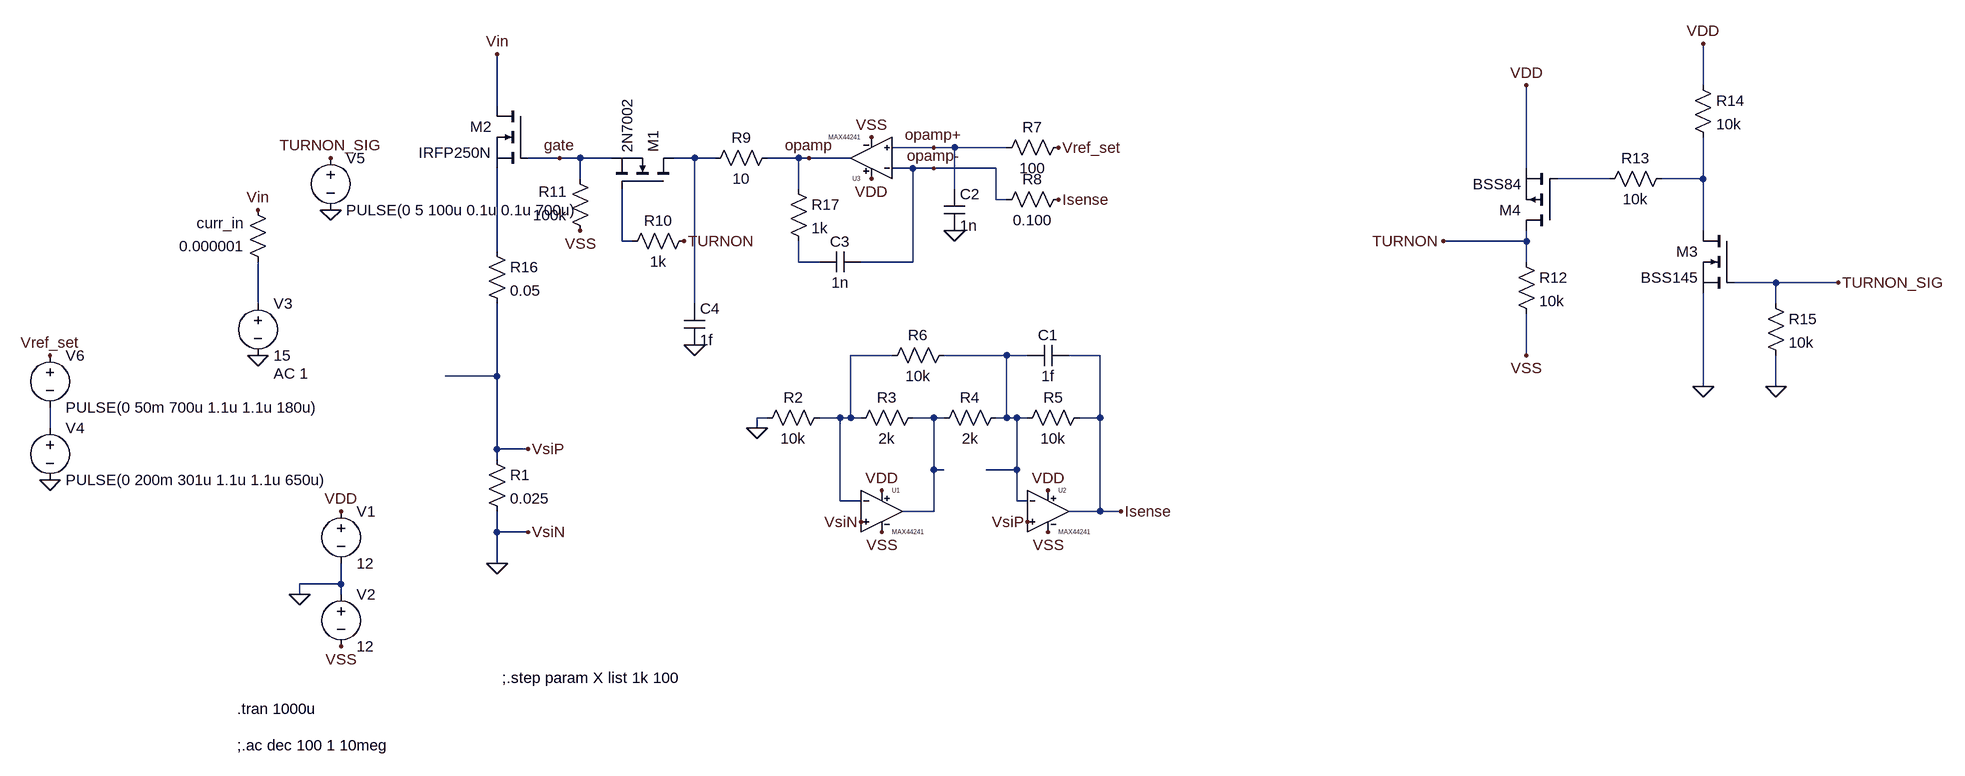
[diagram p0: schematic dc_load_transients.asc]
dc_load_transients.asc, the LTspice schematic file:
Version 4
SHEET 1 1884 680
WIRE 1504 -368 1504 -432
WIRE -352 -336 -352 -416
WIRE 320 -272 256 -272
WIRE 352 -272 320 -272
WIRE 432 -272 352 -272
WIRE -256 -256 -304 -256
WIRE -224 -256 -256 -256
WIRE -176 -256 -224 -256
WIRE -48 -256 -80 -256
WIRE -16 -256 -48 -256
WIRE 112 -256 64 -256
WIRE 128 -256 112 -256
WIRE 192 -256 128 -256
WIRE 288 -240 256 -240
WIRE 320 -240 288 -240
WIRE 416 -240 320 -240
WIRE 1232 -240 1232 -368
WIRE -224 -224 -224 -256
WIRE 1360 -224 1280 -224
WIRE 1504 -224 1504 -288
WIRE 1504 -224 1440 -224
WIRE 112 -208 112 -256
WIRE 352 -208 352 -272
WIRE 416 -192 416 -240
WIRE 432 -192 416 -192
WIRE 1504 -144 1504 -224
WIRE -160 -128 -160 -208
WIRE -144 -128 -160 -128
WIRE 1232 -128 1232 -144
WIRE 1232 -128 1104 -128
WIRE -352 -112 -352 -240
WIRE 112 -96 112 -128
WIRE 144 -96 112 -96
WIRE 288 -96 288 -240
WIRE 288 -96 208 -96
WIRE 1232 -96 1232 -128
WIRE 1616 -64 1552 -64
WIRE 1712 -64 1616 -64
WIRE -720 -32 -720 -96
WIRE -48 -32 -48 -256
WIRE 1616 -32 1616 -64
WIRE 256 48 192 48
WIRE 432 48 336 48
WIRE 464 48 432 48
WIRE 576 48 528 48
WIRE 1232 48 1232 -16
WIRE -352 80 -352 -32
WIRE -352 80 -432 80
WIRE 1504 96 1504 -48
WIRE 1616 96 1616 48
WIRE 64 144 48 144
WIRE 176 144 144 144
WIRE 192 144 192 48
WIRE 192 144 176 144
WIRE 208 144 192 144
WIRE 320 144 288 144
WIRE 336 144 320 144
WIRE 432 144 432 48
WIRE 432 144 416 144
WIRE 448 144 432 144
WIRE 464 144 448 144
WIRE 576 144 576 48
WIRE 576 144 544 144
WIRE -1040 160 -1040 128
WIRE 48 160 48 144
WIRE -352 192 -352 80
WIRE -304 192 -352 192
WIRE -352 208 -352 192
WIRE 320 224 320 144
WIRE 336 224 320 224
WIRE 448 224 448 144
WIRE 448 224 400 224
WIRE 176 272 176 144
WIRE 208 272 176 272
WIRE 448 272 448 224
WIRE 464 272 448 272
WIRE 320 288 320 224
WIRE 320 288 272 288
WIRE 576 288 576 144
WIRE 576 288 528 288
WIRE 608 288 576 288
WIRE -352 320 -352 288
WIRE -304 320 -352 320
WIRE -352 368 -352 320
WIRE -592 400 -592 368
WIRE -592 400 -656 400
WIRE -656 416 -656 400
WIRE -592 416 -592 400
FLAG -352 368 0
FLAG -592 288 VDD
FLAG -592 496 VSS
FLAG -656 416 0
FLAG 240 256 VDD
FLAG 496 256 VDD
FLAG 240 320 VSS
FLAG 496 320 VSS
FLAG 48 160 0
FLAG -304 192 VsiP
FLAG 464 304 VsiP
FLAG -304 320 VsiN
FLAG 208 304 VsiN
FLAG 608 288 Isense
FLAG -720 48 0
FLAG -720 -176 Vin
FLAG -1040 48 Vref_set
FLAG -1040 240 0
FLAG 1504 -432 VDD
FLAG 1232 48 VSS
FLAG 352 -144 0
FLAG -608 -256 TURNON_SIG
FLAG -608 -176 0
FLAG 512 -272 Vref_set
FLAG 512 -192 Isense
FLAG -64 -128 TURNON
FLAG -224 -144 VSS
FLAG -352 -416 Vin
FLAG 1504 96 0
FLAG 1616 96 0
FLAG 1232 -368 VDD
FLAG 1104 -128 TURNON
FLAG 1712 -64 TURNON_SIG
FLAG 224 -224 VDD
FLAG 224 -288 VSS
FLAG -48 32 0
FLAG -256 -256 gate
FLAG 128 -256 opamp
FLAG 320 -272 opamp+
FLAG 320 -240 opamp-
SYMBOL my\\MAX44241 240 224 R0
SYMATTR InstName U1
SYMBOL my\\MAX44241 496 224 R0
SYMATTR InstName U2
SYMBOL res -368 192 R0
SYMATTR InstName R1
SYMATTR Value 0.025
SYMBOL res 160 128 R90
WINDOW 0 0 56 VBottom 2
WINDOW 3 32 56 VTop 2
SYMATTR InstName R2
SYMATTR Value 10k
SYMBOL res 304 128 R90
WINDOW 0 0 56 VBottom 2
WINDOW 3 32 56 VTop 2
SYMATTR InstName R3
SYMATTR Value 2k
SYMBOL res 432 128 R90
WINDOW 0 0 56 VBottom 2
WINDOW 3 32 56 VTop 2
SYMATTR InstName R4
SYMATTR Value 2k
SYMBOL res 560 128 R90
WINDOW 0 0 56 VBottom 2
WINDOW 3 32 56 VTop 2
SYMATTR InstName R5
SYMATTR Value 10k
SYMBOL res 352 32 R90
WINDOW 0 0 56 VBottom 2
WINDOW 3 32 56 VTop 2
SYMATTR InstName R6
SYMATTR Value 10k
SYMBOL voltage -592 272 R0
WINDOW 123 0 0 Left 2
WINDOW 39 0 0 Left 2
SYMATTR InstName V1
SYMATTR Value 12
SYMBOL voltage -592 400 R0
WINDOW 123 0 0 Left 2
WINDOW 39 0 0 Left 2
SYMATTR InstName V2
SYMATTR Value 12
SYMBOL voltage -720 -48 R0
WINDOW 123 24 124 Left 2
WINDOW 39 0 0 Left 2
SYMATTR Value2 AC 1
SYMATTR InstName V3
SYMATTR Value 15
SYMBOL voltage -1040 144 R0
WINDOW 123 0 0 Left 2
WINDOW 39 0 0 Left 2
SYMATTR InstName V4
SYMATTR Value PULSE(0 200m 301u 1.1u 1.1u 650u)
SYMBOL my\\MAX44241 224 -192 R180
SYMATTR InstName U3
SYMBOL res 528 -288 R90
WINDOW 0 0 56 VBottom 2
WINDOW 3 32 56 VTop 2
SYMATTR InstName R7
SYMATTR Value 100
SYMBOL res 528 -208 R90
WINDOW 0 0 56 VBottom 2
WINDOW 3 32 56 VTop 2
SYMATTR InstName R8
SYMATTR Value 0.100
SYMBOL cap 336 -208 R0
SYMATTR InstName C2
SYMATTR Value 1n
SYMBOL voltage -608 -272 R0
WINDOW 123 0 0 Left 2
WINDOW 39 0 0 Left 2
SYMATTR InstName V5
SYMATTR Value PULSE(0 5 100u 0.1u 0.1u 700u)
SYMBOL res 80 -272 R90
WINDOW 0 0 56 VBottom 2
WINDOW 3 32 56 VTop 2
SYMATTR InstName R9
SYMATTR Value 10
SYMBOL nmos -80 -208 M270
SYMATTR InstName M1
SYMATTR Value 2N7002
SYMBOL res -48 -144 R90
WINDOW 0 0 56 VBottom 2
WINDOW 3 32 56 VTop 2
SYMATTR InstName R10
SYMATTR Value 1k
SYMBOL res -208 -128 R180
WINDOW 0 36 76 Left 2
WINDOW 3 36 40 Left 2
SYMATTR InstName R11
SYMATTR Value 100k
SYMBOL nmos -304 -336 M0
SYMATTR InstName M2
SYMATTR Value IRFP250N
SYMBOL nmos 1552 -144 M0
SYMATTR InstName M3
SYMATTR Value BSS145
SYMBOL pmos 1280 -144 R180
SYMATTR InstName M4
SYMATTR Value BSS84
SYMBOL res 1216 -112 R0
SYMATTR InstName R12
SYMATTR Value 10k
SYMBOL res 1456 -240 R90
WINDOW 0 0 56 VBottom 2
WINDOW 3 32 56 VTop 2
SYMATTR InstName R13
SYMATTR Value 10k
SYMBOL res 1488 -384 R0
SYMATTR InstName R14
SYMATTR Value 10k
SYMBOL res 1600 -48 R0
SYMATTR InstName R15
SYMATTR Value 10k
SYMBOL cap 528 32 R90
WINDOW 0 0 32 VBottom 2
WINDOW 3 32 32 VTop 2
SYMATTR InstName C1
SYMATTR Value 1f
SYMBOL cap 208 -112 R90
WINDOW 0 0 32 VBottom 2
WINDOW 3 32 32 VTop 2
SYMATTR InstName C3
SYMATTR Value 1n
SYMBOL res -368 -128 R0
SYMATTR InstName R16
SYMATTR Value 0.05
SYMBOL res -704 -80 R180
WINDOW 0 36 76 Left 2
WINDOW 3 36 40 Left 2
SYMATTR InstName curr_in
SYMATTR Value 0.000001
SYMBOL voltage -1040 32 R0
WINDOW 123 0 0 Left 2
WINDOW 39 0 0 Left 2
SYMATTR InstName V6
SYMATTR Value PULSE(0 50m 700u 1.1u 1.1u 180u)
SYMBOL res 96 -224 R0
SYMATTR InstName R17
SYMATTR Value 1k
SYMBOL cap -64 -32 R0
SYMATTR InstName C4
SYMATTR Value 1f
TEXT -752 592 Left 2 !.tran 1000u
TEXT -344 544 Left 2 !;.step param X list 1k 100
TEXT -752 648 Left 2 !;.ac dec 100 1 10meg

The netlist it stands for:
* dc_load_transients.asc
XU1 0 N008 VDD VSS N010 MAX44241  ; pins INA+ INA- VDD VSS OUTA
XU2 VsiP N009 VDD VSS Isense MAX44241  ; pins INA+ INA- VDD VSS OUTA
R1 VsiP 0 0.025
R2 N008 0 10k
R3 N010 N008 2k
R4 N009 N010 2k
R5 Isense N009 10k
R6 N009 N008 10k
V1 VDD 0 12
V2 0 VSS 12
V3 N007 0 15 AC 1
V4 N011 0 PULSE(0 200m 301u 1.1u 1.1u 650u)
XU3 opamp+ opamp- VDD VSS opamp MAX44241  ; pins INA+ INA- VDD VSS OUTA
R7 Vref_set opamp+ 100
R8 Isense opamp- 0.100
C2 opamp+ 0 1n
V5 TURNON_SIG 0 PULSE(0 5 100u 0.1u 0.1u 700u)
R9 opamp N001 10
M1 N001 N004 gate gate 2N7002
R10 TURNON N004 1k
R11 VSS gate 100k
M2 Vin gate N005 N005 IRFP250N
M3 N003 TURNON_SIG 0 0 BSS145
M4 TURNON N002 VDD VDD BSS84
R12 TURNON VSS 10k
R13 N003 N002 10k
R14 VDD N003 10k
R15 TURNON_SIG 0 10k
C1 Isense N009 1f
C3 opamp- N006 1n
R16 N005 VsiP 0.05
R§curr_in N007 Vin 0.000001
V6 Vref_set N011 PULSE(0 50m 700u 1.1u 1.1u 180u)
R17 opamp N006 1k
C4 N001 0 1f
.model NMOS NMOS
.model PMOS PMOS
.lib standard.mos
.tran 1000u
;.step param X list 1k 100
;.ac dec 100 1 10meg
.lib MAX44241.lib
.backanno
.end